# Altium project ESP_VGA.PrjPcb
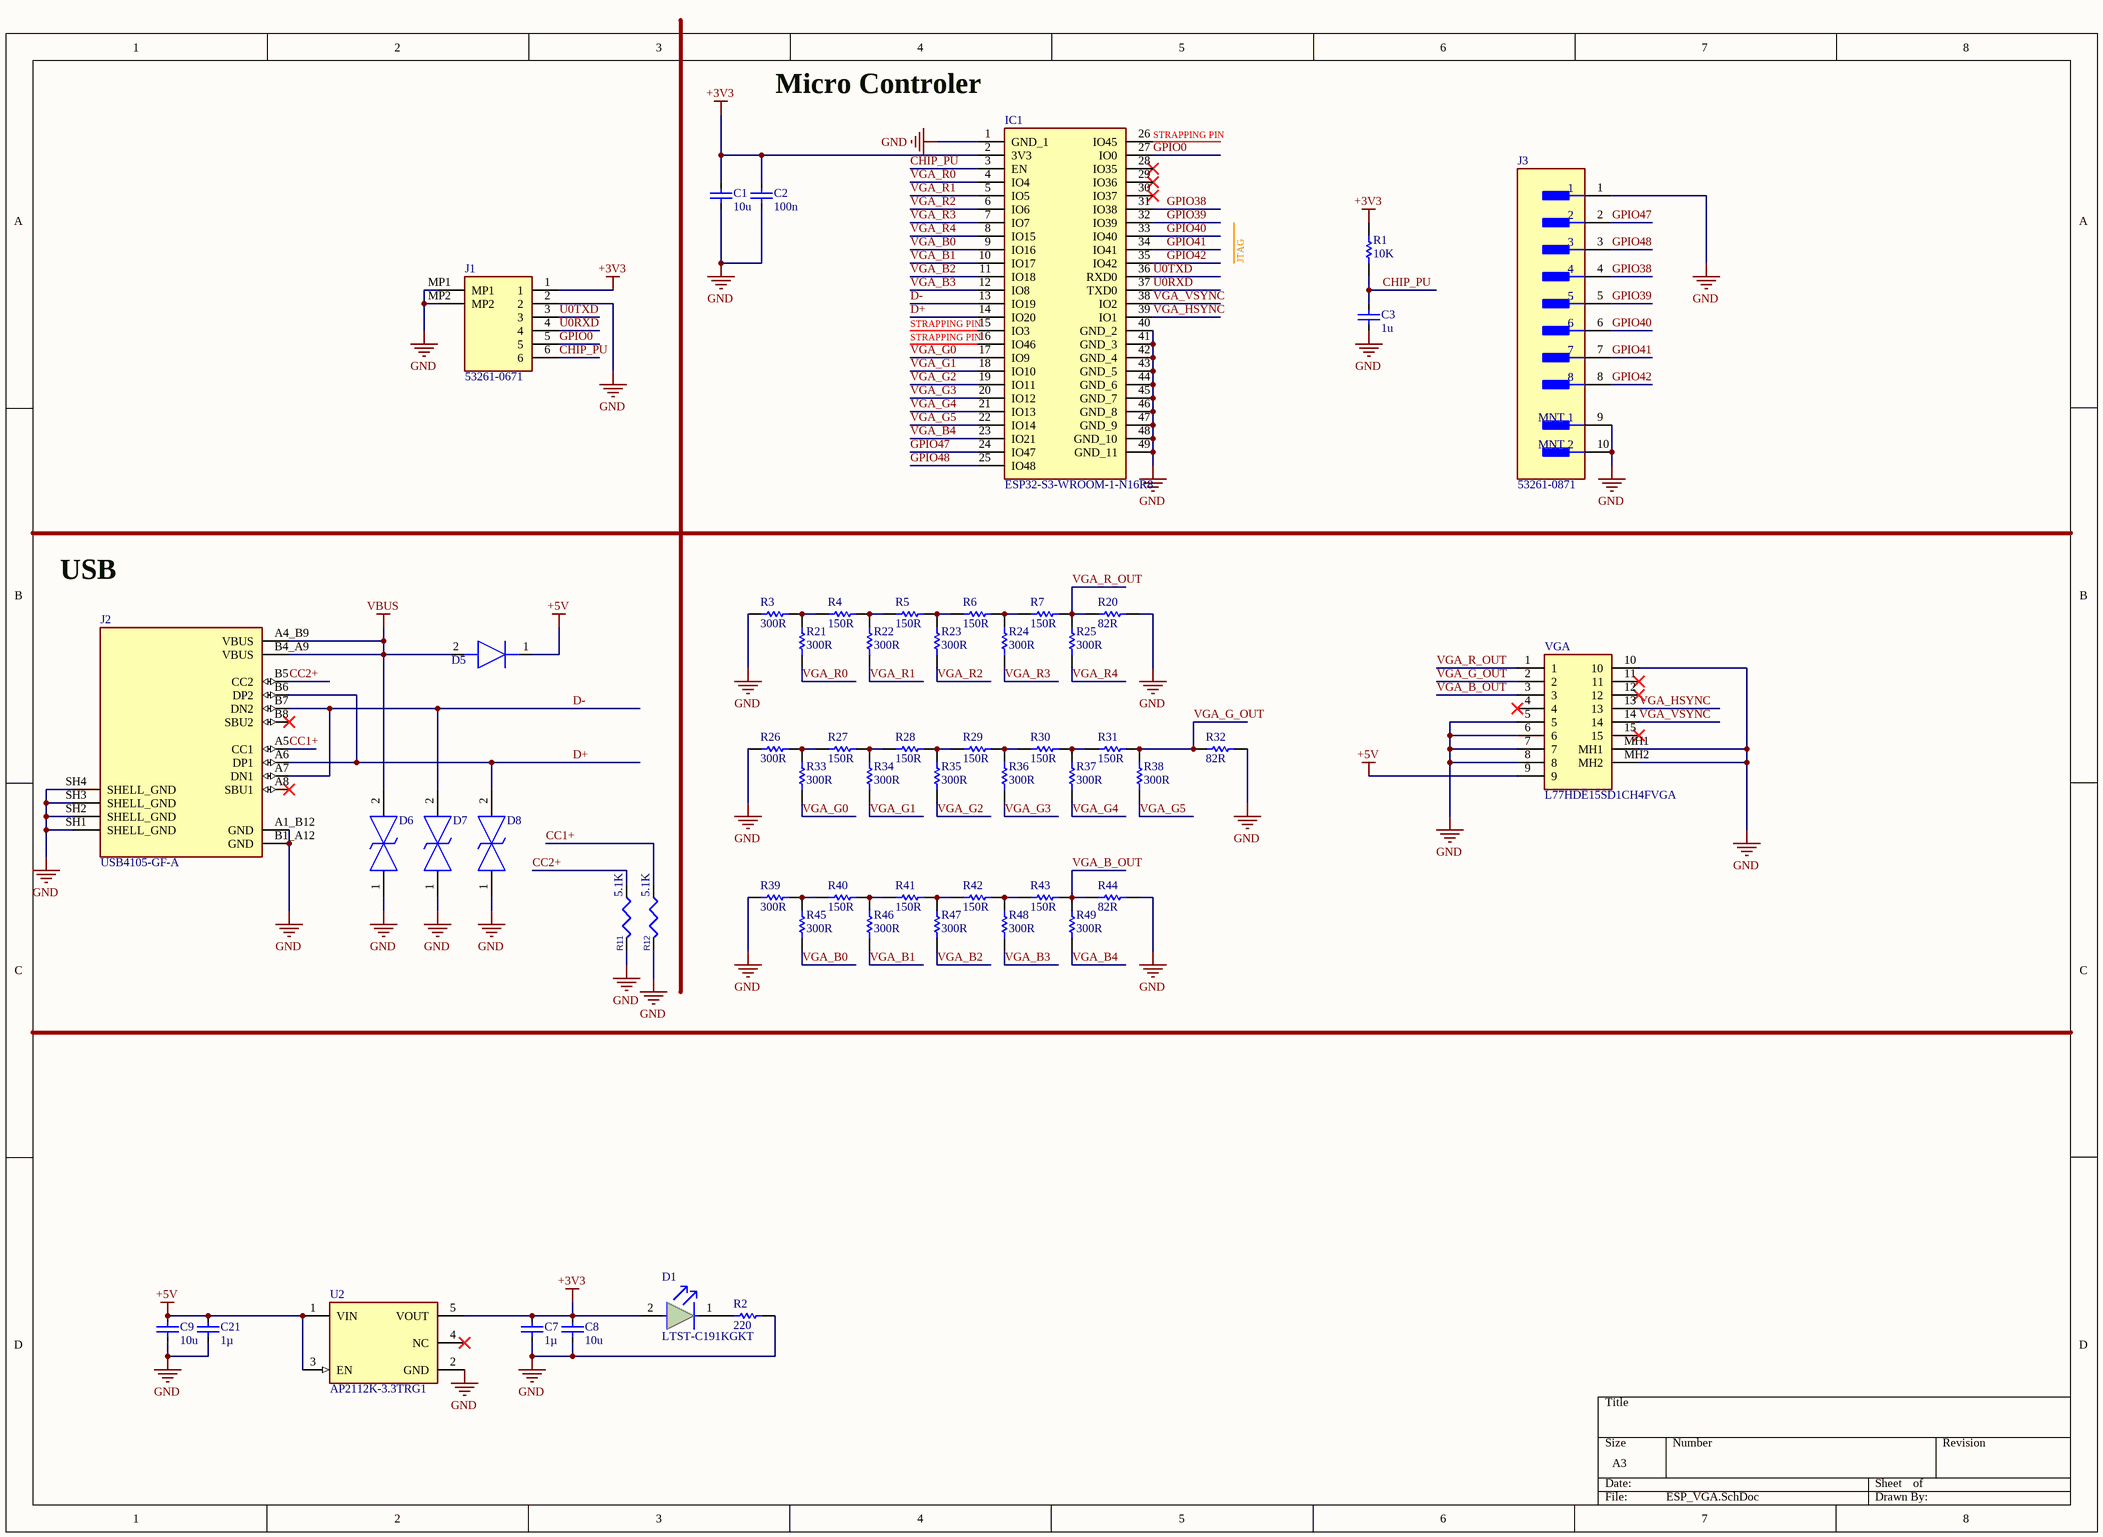
[diagram p0: ESP_VGA.SchDoc]
1 sheet, 57 parts. Net scope: global (net labels, ports and power ports of the same name join across sheets).
Board file: ESP_VGA.PcbDoc

## Sheet ESP_VGA.SchDoc
size A3; SheetNumber: 1; SheetTotal: 1

### Parts
C1  value 10u  [FP-C1608-080-0_1-IPC_C]  (hidden comment: C1608JB0J106K080AB)
C2  value 100n  [FP-C1005-050-0_05-IPC_C]  (hidden comment: C1005X7R1H104K050BB)
C3  value 1u  [FP-C1608-080-0_1-IPC_B]  (hidden comment: C1608X5R1H105K080AB)
C7  value 1µ  [CAPC1005X55X10LL05]  (hidden comment: C1005X5R1A105K050BB)
C8  value 10u  [CAPC1608X100X20LL10]  (hidden comment: C1608X5R1E106M080AC)
C9  value 10u  [CAPC1608X100X20LL10]  (hidden comment: C1608X5R1E106M080AC)
C21  value 1µ  [CAPC1005X55X10LL05]  (hidden comment: C1005X5R1A105K050BB)
D1  LTST-C191KGKT  [FP-LTST-C191KGKT-MFG]
D5  1N5819HW-7-F  [SOD3716X125N]  (value not drawn)
D6  LESD5D5.0CT1G  [LESD5D50CT1G]  (value not drawn)
D7  LESD5D5.0CT1G  [LESD5D50CT1G]  (value not drawn)
D8  LESD5D5.0CT1G  [LESD5D50CT1G]  (value not drawn)
IC1  ESP32-S3-WROOM-1-N16R8  [ESP32S3WROOM1N16R8]
J1  53261-0671  [532610671]
J2  USB4105-GF-A  [GCT_USB4105-GF-A]
J3  53261-0871  [FP-532610871-MFG]
R1  value 10K  [RESC1005X40X25LL05T10]  (hidden comment: RC0402FR-0710KL)
R2  value 220  [RESC1005X40X25LL05T10]  (hidden comment: RC0402FR-07220RL)
R3  value 300R  [RESC1005X40X25ML05T10]  (hidden comment: RC0402FR-07300RL)
R4  value 150R  [RESC1005X40X25ML05T10]  (hidden comment: RC0402FR-07150RL)
R5  value 150R  [RESC1005X40X25ML05T10]  (hidden comment: RC0402FR-07150RL)
R6  value 150R  [RESC1005X40X25ML05T10]  (hidden comment: RC0402FR-07150RL)
R7  value 150R  [RESC1005X40X25ML05T10]  (hidden comment: RC0402FR-07150RL)
R11  value 5.1K  [RESC1005X40N]  (hidden comment: RC0402FR-075K1P)
R12  value 5.1K  [RESC1005X40N]  (hidden comment: RC0402FR-075K1P)
R20  value 82R  [RESC1005X40X25ML05T10]  (hidden comment: RC0402FR-0782RL)
R21  value 300R  [RESC1005X40X25ML05T10]  (hidden comment: RC0402FR-07300RL)
R22  value 300R  [RESC1005X40X25ML05T10]  (hidden comment: RC0402FR-07300RL)
R23  value 300R  [RESC1005X40X25ML05T10]  (hidden comment: RC0402FR-07300RL)
R24  value 300R  [RESC1005X40X25ML05T10]  (hidden comment: RC0402FR-07300RL)
R25  value 300R  [RESC1005X40X25ML05T10]  (hidden comment: RC0402FR-07300RL)
R26  value 300R  [RESC1005X40X25ML05T10]  (hidden comment: RC0402FR-07300RL)
R27  value 150R  [RESC1005X40X25ML05T10]  (hidden comment: RC0402FR-07150RL)
R28  value 150R  [RESC1005X40X25ML05T10]  (hidden comment: RC0402FR-07150RL)
R29  value 150R  [RESC1005X40X25ML05T10]  (hidden comment: RC0402FR-07150RL)
R30  value 150R  [RESC1005X40X25ML05T10]  (hidden comment: RC0402FR-07150RL)
R31  value 150R  [RESC1005X40X25ML05T10]  (hidden comment: RC0402FR-07150RL)
R32  value 82R  [RESC1005X40X25ML05T10]  (hidden comment: RC0402FR-0782RL)
R33  value 300R  [RESC1005X40X25ML05T10]  (hidden comment: RC0402FR-07300RL)
R34  value 300R  [RESC1005X40X25ML05T10]  (hidden comment: RC0402FR-07300RL)
R35  value 300R  [RESC1005X40X25ML05T10]  (hidden comment: RC0402FR-07300RL)
R36  value 300R  [RESC1005X40X25ML05T10]  (hidden comment: RC0402FR-07300RL)
R37  value 300R  [RESC1005X40X25ML05T10]  (hidden comment: RC0402FR-07300RL)
R38  value 300R  [RESC1005X40X25ML05T10]  (hidden comment: RC0402FR-07300RL)
R39  value 300R  [RESC1005X40X25ML05T10]  (hidden comment: RC0402FR-07300RL)
R40  value 150R  [RESC1005X40X25ML05T10]  (hidden comment: RC0402FR-07150RL)
R41  value 150R  [RESC1005X40X25ML05T10]  (hidden comment: RC0402FR-07150RL)
R42  value 150R  [RESC1005X40X25ML05T10]  (hidden comment: RC0402FR-07150RL)
R43  value 150R  [RESC1005X40X25ML05T10]  (hidden comment: RC0402FR-07150RL)
R44  value 82R  [RESC1005X40X25ML05T10]  (hidden comment: RC0402FR-0782RL)
R45  value 300R  [RESC1005X40X25ML05T10]  (hidden comment: RC0402FR-07300RL)
R46  value 300R  [RESC1005X40X25ML05T10]  (hidden comment: RC0402FR-07300RL)
R47  value 300R  [RESC1005X40X25ML05T10]  (hidden comment: RC0402FR-07300RL)
R48  value 300R  [RESC1005X40X25ML05T10]  (hidden comment: RC0402FR-07300RL)
R49  value 300R  [RESC1005X40X25ML05T10]  (hidden comment: RC0402FR-07300RL)
U2  AP2112K-3.3TRG1  [FP-SOT25-IPC_A]
VGA  L77HDE15SD1CH4FVGA  [L77HDE15SD1CH4FVGA]

### Nets
+3V3: C1.1 C2.1 C7.1 C8.1 D1.2(A) IC1.2(3V3) J1.1 R1.2 U2.5(VOUT)
+5V: C9.2 C21.2 D5.1(K) U2.1(VIN) U2.3(EN) VGA.9
GND: C1.2 C2.2 C3.2 C7.2 C8.2 C9.1 C21.1 D6.1 D7.1 D8.1 IC1.1(GND_1) IC1.40(GND_2) IC1.41(GND_3) IC1.42(GND_4) IC1.43(GND_5) IC1.44(GND_6) IC1.45(GND_7) IC1.46(GND_8) IC1.47(GND_9) IC1.48(GND_10) IC1.49(GND_11) J1.2 J1.MP1 J1.MP2 J2.A1_B12(GND) J2.B1_A12(GND) J2.SH1(SHELL_GND) J2.SH2(SHELL_GND) J2.SH3(SHELL_GND) J2.SH4(SHELL_GND) J3.1 J3.9(MNT_1) J3.10(MNT_2) R2.1 R3.2 R11.2 R12.2 R20.2 R26.2 R32.2 R39.2 R44.2 U2.2(GND) VGA.5 VGA.6 VGA.7 VGA.8 VGA.10 VGA.MH1 VGA.MH2
VBUS: D5.2(A) D6.2 J2.A4_B9(VBUS) J2.B4_A9(VBUS)
CC1+: J2.A5(CC1) R12.1
CC2+: J2.B5(CC2) R11.1
CHIP_PU: C3.1 IC1.3(EN) J1.6 R1.1
D+: D8.2 IC1.14(IO20) J2.A6(DP1) J2.B6(DP2)
D-: D7.2 IC1.13(IO19) J2.A7(DN1) J2.B7(DN2)
GPIO0: IC1.27(IO0) J1.5
GPIO38: IC1.31(IO38) J3.4
GPIO39: IC1.32(IO39) J3.5
GPIO40: IC1.33(IO40) J3.6
GPIO41: IC1.34(IO41) J3.7
GPIO42: IC1.35(IO42) J3.8
GPIO47: IC1.24(IO47) J3.2
GPIO48: IC1.25(IO48) J3.3
U0RXD: IC1.37(TXD0) J1.4
U0TXD: IC1.36(RXD0) J1.3
VGA_B0: IC1.9(IO16) R45.1
VGA_B1: IC1.10(IO17) R46.1
VGA_B2: IC1.11(IO18) R47.1
VGA_B3: IC1.12(IO8) R48.1
VGA_B4: IC1.23(IO21) R49.1
VGA_B_OUT: R43.1 R44.1 R49.2 VGA.3
VGA_G0: IC1.17(IO9) R33.1
VGA_G1: IC1.18(IO10) R34.1
VGA_G2: IC1.19(IO11) R35.1
VGA_G3: IC1.20(IO12) R36.1
VGA_G4: IC1.21(IO13) R37.1
VGA_G5: IC1.22(IO14) R38.1
VGA_G_OUT: R31.1 R32.1 R38.2 VGA.2
VGA_HSYNC: IC1.39(IO1) VGA.13
VGA_R0: IC1.4(IO4) R21.1
VGA_R1: IC1.5(IO5) R22.1
VGA_R2: IC1.6(IO6) R23.1
VGA_R3: IC1.7(IO7) R24.1
VGA_R4: IC1.8(IO15) R25.1
VGA_R_OUT: R7.1 R20.1 R25.2 VGA.1
VGA_VSYNC: IC1.38(IO2) VGA.14
NetD1_1: D1.1(C) R2.2
NetR3_1: R3.1 R4.2 R21.2
NetR4_1: R4.1 R5.2 R22.2
NetR5_1: R5.1 R6.2 R23.2
NetR6_1: R6.1 R7.2 R24.2
NetR26_1: R26.1 R27.2 R33.2
NetR27_1: R27.1 R28.2 R34.2
NetR28_1: R28.1 R29.2 R35.2
NetR29_1: R29.1 R30.2 R36.2
NetR30_1: R30.1 R31.2 R37.2
NetR39_1: R39.1 R40.2 R45.2
NetR40_1: R40.1 R41.2 R46.2
NetR41_1: R41.1 R42.2 R47.2
NetR42_1: R42.1 R43.2 R48.2

Not connected (* = marked no-connect by the designer): IC1 15(IO3) 16(IO46) 26(IO45) 28(IO35)* 29(IO36)* 30(IO37)*; J2 A8(SBU1)* B8(SBU2)*; U2 4(NC)*; VGA 4* 11* 12* 15*

### Notes on the sheet
- (near IC1) Micro Controler
- (near IC1) STRAPPING PIN
- JTAG
- USB

### Library data of the parts
C1 = C1608JB0J106K080AB: MLCC 10μF ±10% 6.3V JB SMD 0603; Dielectric Material: Ceramic; Case Code (Imperial): 0603; Thickness: 0.035inch; Min Operating Temperature: -25°C; Termination: SMD/SMT; Lead Free: Lead Free; Resistor Type: Ceramic; Width: 0.8mm; Voltage Rating (DC): 6.3V; Package Quantity: 4000; Tolerance: 10%; Length: 0.063inch; Series: C; Height: 0.8mm; Max Operating Temperature: 85°C; Mount: Surface Mount; RoHS Compliant: Yes; Voltage Rating: 6.3V; Case Code (Metric): 1608; Case/Package: 0603; Packaging: Tape and Reel
C2 = C1005X7R1H104K050BB: MLCC 100nF ±10% 50V X7R SMD 0402; Dielectric Material: Ceramic; Voltage: 50V; Min Operating Temperature: -55°C; Depth: 0.5mm; Radiation Hardening: No; RoHS Compliant: Yes; Voltage Rating (DC): 50V; Lead Free: Lead Free; Resistor Type: Ceramic; Height: 0.5mm; Dielectric: X7R; Thickness: 0.022inch; Case/Package: 0402; Case Code (Metric): 1005; Termination: SMD/SMT; Packaging: Tape and Reel; Max Operating Temperature: 125°C; Mount: Surface Mount; Package Quantity: 1; Width: 0.02inch; Weight: 2.3E-05oz; Voltage Rating: 50V; Tolerance: 10%; Construction: Flat; Case Code (Imperial): 0402; Length: 1mm; REACH SVHC: No SVHC; Series: C; Part Number: C1005X7R1H104K050BB
C3 = C1608X5R1H105K080AB: MLCC 1μF ±10% 50V X5R SMD 0603; Dielectric Material: Ceramic; Lead Free: Lead Free; Height: 0.8mm; Mount: Surface Mount; Radiation Hardening: No; Thickness: 0.035inch; Length: 1.6mm; Max Operating Temperature: 85°C; REACH SVHC: No SVHC; Min Operating Temperature: -55°C; Construction: Flat; RoHS Compliant: Yes; Voltage Rating: 50V; Dielectric: X5R; Packaging: Tape and Reel; Termination: SMD/SMT; Voltage Rating (DC): 50V; Case Code (Imperial): 0603; Voltage: 50V; Width: 0.031inch; Weight: 7.1E-05oz; Depth: 0.8mm; Case Code (Metric): 1608; Series: C; Case/Package: 0603; Tolerance: 10%; Resistor Type: Ceramic; Number of Pins: 2; Package Quantity: 1; Part Number: C1608X5R1H105K080AB
C7 C21 = C1005X5R1A105K050BB: MLCC 1 uF, +/- 10%, 10 V, -55 to 85 degC, 0402 (1005 Metric), RoHS, Tape and Reel; Manufacturer: TDK; PCN Part Number: MLCCPartNumberChange30/Nov/2012; Product Training Modules: CSeriesGeneralApplicationsSEAT,CCV,andTVCLDesignToolsGuidetoReplacinganElectrolyticCapacitorwithanMLCC; Voltage - Rated: 10V; Temperature Coefficient: X5R; Online Catalog: CSeries,GeneralPurpose; Other Names: 445-4114-6; Category: Capacitors; Features: -; Lead Style: -; RoHS Information: RoHSCertificate-MLCC; Manufacturer URL: http://www.tdk.com/; Lead Spacing: -; Thickness (Max): 0.022"(0.55mm); Applications: GeneralPurpose; Tolerance: ±10%; Mounting Technology: SurfaceMount; Mounting Type: SurfaceMount,MLCC; Operating Temperature: -55°C~85°C; Datasheet URL: http://download.siliconexpert.com/pdfs/2015/4/21/15/54/45/779/tdk_/manual/37024850441143360mlcc_commercial_general_en.pdf; Package Reference: 1005; Height - Seated (Max): -; Family: CeramicCapacitors; Datasheet Version: 03/2015; Package Description: 2-Pin Surface Mount Device, Body 1 x 0.5 mm; Packaging: Digi-Reel®; Size / Dimension: 0.039"Lx0.020"W(1.00mmx0.50mm); Standard Package: 1; Package / Case: 0402(1005Metric); Ratings: -; Series: C; Part Number: C1005X5R1A105K050BB
C8 C9 = C1608X5R1E106M080AC: MLCC 10UF, 25V; Manufacturer_Name: TDK; Datasheet Link: https://product.tdk.com/info/en/catalog/datasheets/mlcc_commercial_midvoltage_en.pdf; Height: 0.8mm; Manufacturer_Part_Number: C1608X5R1E106M080AC; Mouser Part Number: 810-C1608X5R1E106M; Mouser Price/Stock: https://www.mouser.co.uk/ProductDetail/TDK/C1608X5R1E106M080AC?qs=dfay7wIA1uGdHfZTkqsICA%3D%3D; Arrow Part Number: C1608X5R1E106M080AC; Arrow Price/Stock: https://www.arrow.com/en/products/c1608x5r1e106m080ac/tdk.html?utm_currency=USD&region=nac
D1 = LTST-C191KGKT: LED GREEN CLEAR SMD; NexarPartId: 549907; Forward Voltage: 2V; Viewing Angle: 130°; Power Rating: 75mW; Number of LEDs: 1; Luminous Intensity: 35mcd; Forward Current: 20mA; Dominant Wavelength: 571nm; Lens Color: Clear, Colorless; Reverse Voltage: 5V; Wavelength: 574nm; Number of Pins: 2; Lens Transparency: Clear; Packaging: Tape and Reel; Number of Elements: 1; Schedule B: 8541402000, 8541402000; Height: 550µm; Case/Package: 0603; Illumination Color: Green; Depth: 800µm; Max Operating Temperature: 85°C; RoHS: Compliant; Lens Style: Clear; Lead Free: Lead Free; Length: 1.6mm; Mount: Surface Mount; Test Current: 20mA; Width: 800µm; Case Code (Imperial): 0603; Min Operating Temperature: -55°C; Case Code (Metric): 1608; Radiation Hardening: No; Power Dissipation: 75mW; Value: Green
D5 = 1N5819HW-7-F: Diode; Manufacturer_Name: Multicomp Pro; Datasheet Link: http://www.farnell.com/datasheets/1693720.pdf; Height: 1.25mm; Manufacturer_Part_Number: 1N5819HW-7-F
D6-D8 = LESD5D5.0CT1G: TVS Diode (Bi-directional); Manufacturer_Name: LRC; Height: 0.7mm; Manufacturer_Part_Number: LESD5D5.0CT1G
IC1 = ESP32-S3-WROOM-1-N16R8: Integrated Circuit; Manufacturer_Name: Espressif Systems; Datasheet Link: https://www.espressif.com/sites/default/files/documentation/esp32-s3-wroom-1_wroom-1u_datasheet_en.pdf; Height: 3.25mm; Manufacturer_Part_Number: ESP32-S3-WROOM-1-N16R8; Mouser Part Number: 356-ESP32S3WRM1N16R8; Mouser Price/Stock: https://www.mouser.co.uk/ProductDetail/Espressif-Systems/ESP32-S3-WROOM-1-N16R8?qs=Li%252BoUPsLEnvQc9gW6AMhZg%3D%3D
J1 = 53261-0671: Connector; Manufacturer_Name: Molex; Datasheet Link: https://www.molex.com/pdm_docs/sd/532610671_sd.pdf; Height: 3.6mm; Manufacturer_Part_Number: 53261-0671; Mouser Part Number: 538-53261-0671; Mouser Price/Stock: https://www.mouser.co.uk/ProductDetail/Molex/53261-0671?qs=%252B72YyncTwW9Wyr77z4J2cA%3D%3D; Arrow Part Number: 53261-0671; Arrow Price/Stock: https://www.arrow.com/en/products/53261-0671/molex?region=nac
J2 = USB4105-GF-A: MF: {'manufacturer': u'GCT'}; Package: None; Price: None; Value: *; MP: USB4105-GF-A; Availability: Unavailable
J3 = CMP-04776-000063-2: CONN HEADER SMD R/A 8POS 1.25MM; NexarPartId: 655316; Manufacturer Lifecycle Status: ACTIVE; Plating: Tin; Gender: Male; Voltage Rating (DC): 125V; Glow Wire Compliant: Non-compliant; Contact Resistance: 20mΩ; Current Rating: 1A; Number of Circuits: 8; Insulation Resistance: 100MΩ; Radiation Hardening: No; Housing Material: Thermoplastic; Number of Pins: 8; Termination: Solder; Min Operating Temperature: -40°C; Contact Material: Brass, Tin; Flammability Rating: UL94 V-0; Color: Beige; Packaging: Cut Tape; Contact Plating: Tin; Max Operating Temperature: 85°C; Working Voltage: 125V; Ambient Temperature Range High: 105°C; Lead Pitch: 1.25mm; Height: 3.6mm; Pitch: 1.25mm; Mount: Surface Mount; Voltage Rating (AC): 125V; Number of Positions: 8; Schedule B: 8536694040; Voltage Rating: 125V; Number of Contacts: 8; Country of Origin: SG; RoHS: Compliant; Number of Rows: 1; Lead Free: Lead Free; REACH SVHC: Unknown; Orientation: Right Angle; Lifecycle Status: Production
R1 = RC0402FR-0710KL: Manufacturer: Yageo / Phycomp; Part Number: RC0402FR-0710KL
R2 = RC0402FR-07220RL: Manufacturer: Yageo / Phycomp; Part Number: RC0402FR-07220RL; Supplier 1: Avnet; Supplier Part Number 1: RC0402FR-07220RL
R3 R21-R26 R33-R39 R45-R49 = RC0402FR-07300RL: Manufacturer: Yageo / Phycomp; Part Number: RC0402FR-07300RL
R4-R7 R27-R31 R40-R43 = RC0402FR-07150RL: Manufacturer: Yageo / Phycomp; Part Number: RC0402FR-07150RL
R11 R12 = RES: RES SMD 5.1KOHM 1% 1/16W 0402; PART_NUMBER: TMP-441; Manufacturer: Yageo; Temperature Coefficient: 100ppm/C; Rated Power: 0.063W, 1/16W; CLASS: DISCRETE; Package Size: 0402 (1005 Metric); Tolerance: 1%
R20 R32 R44 = RC0402FR-0782RL: Manufacturer: Yageo / Phycomp; Part Number: RC0402FR-0782RL
U2 = CMP-12756-000035-1: IC REG LINEAR 3.3V 600MA SOT25; Number of Regulators: 1; Output Type: Fixed; Polarity: Positive; Min Input Voltage: 2.5V; Max Input Voltage: 6V; Accuracy: 1.5%; Quiescent Current: 55uA; Dropout Voltage: 250mV; Min Operating Temperature: -40°C; Length: 3.1mm; Output Current: 600mA; Max Operating Temperature: 85°C; Package Quantity: 1; Output Voltage: 3.3V; Width: 1.7mm; Number of Outputs: 1; Packaging: Tape and Reel; Height: 1.3mm; Lead Free: Lead Free; Max Output Current: 600mA; Case/Package: SOT-23-5; Mount: Surface Mount; Number of Pins: 5
VGA = L77HDE15SD1CH4FVGA: Connector; Manufacturer_Name: Amphenol Communications Solutions; Datasheet Link: https://cdn.amphenol-cs.com/media/wysiwyg/files/drawing/l77hde15sd1ch4fvga.pdf; Height: 12.85mm; Manufacturer_Part_Number: L77HDE15SD1CH4FVGA; Mouser Part Number: 523-7HDE15SD1CH4FVGA; Mouser Price/Stock: https://www.mouser.co.uk/ProductDetail/Amphenol-Commercial-Products/L77HDE15SD1CH4FVGA?qs=ToP8pWlZ0bNtQSp9f8k5Rw%3D%3D; Arrow Part Number: L77HDE15SD1CH4FVGA; Arrow Price/Stock: https://www.arrow.com/en/products/l77hde15sd1ch4fvga/amphenol-fci.html?utm_currency=USD&region=nac